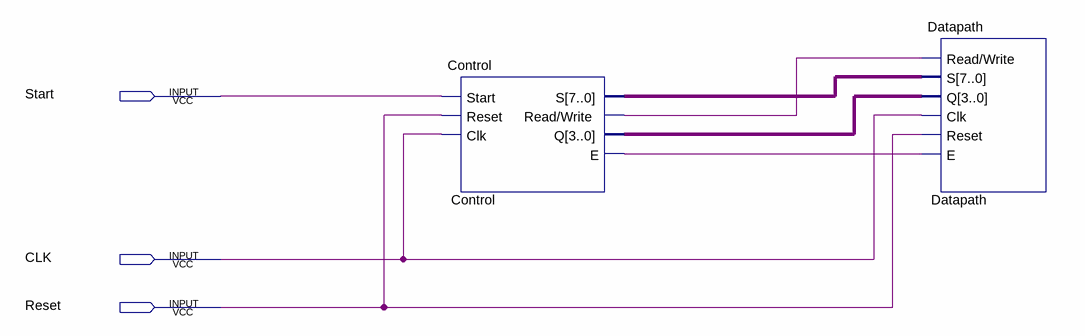
[diagram p0: schematic sheet]
// Quartus schematic Project.bdf as structural Verilog: 2 symbols, 3 pins
module Project (
  input  Start,
  input  CLK,
  input  Reset
);

  wire Control_e, Control_read_write;
  wire [3:0] Control_q;
  wire [7:0] Control_s;

  Control Control (
    .Start(Start), .Reset(Reset), .Clk(CLK), .S(Control_s), .\Read/Write (Control_read_write), .Q(Control_q),
    .E(Control_e));
  Datapath Datapath (
    .\Read/Write (Control_read_write), .S(Control_s), .Q(Control_q), .Clk(CLK), .Reset(Reset), .E(Control_e));
endmodule
